# Altium schematic sheet C19272232_SCH.SchDoc
size 127 x 101 mm
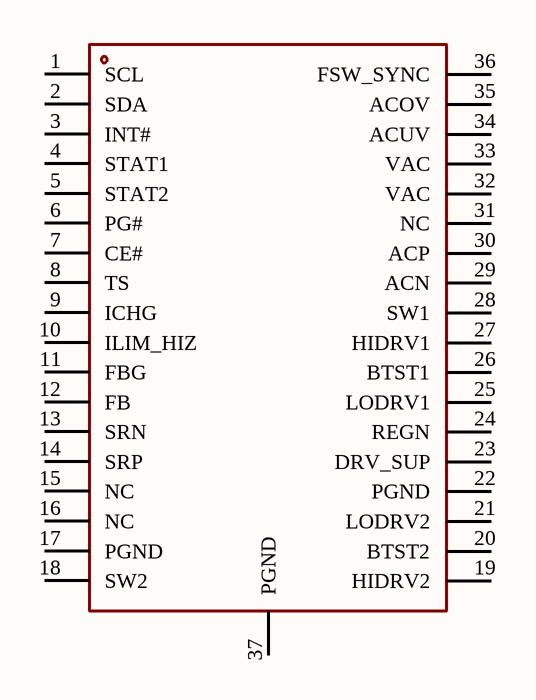
[diagram p0: C19272232_SCH.SchDoc]

## Parts
U??  BQ25756RRVR  (value not drawn)

## Nets

Not connected (* = marked no-connect by the designer): U?? 1(SCL) 2(SDA) 3(INT#) 4(STAT1) 5(STAT2) 6(PG#) 7(CE#) 8(TS) 9(ICHG) 10(ILIM_HIZ) 11(FBG) 12(FB) 13(SRN) 14(SRP) 15(NC) 16(NC) 17(PGND) 18(SW2) 19(HIDRV2) 20(BTST2) 21(LODRV2) 22(PGND) 23(DRV_SUP) 24(REGN) 25(LODRV1) 26(BTST1) 27(HIDRV1) 28(SW1) 29(ACN) 30(ACP) 31(NC) 32(VAC) 33(VAC) 34(ACUV) 35(ACOV) 36(FSW_SYNC) 37(PGND)